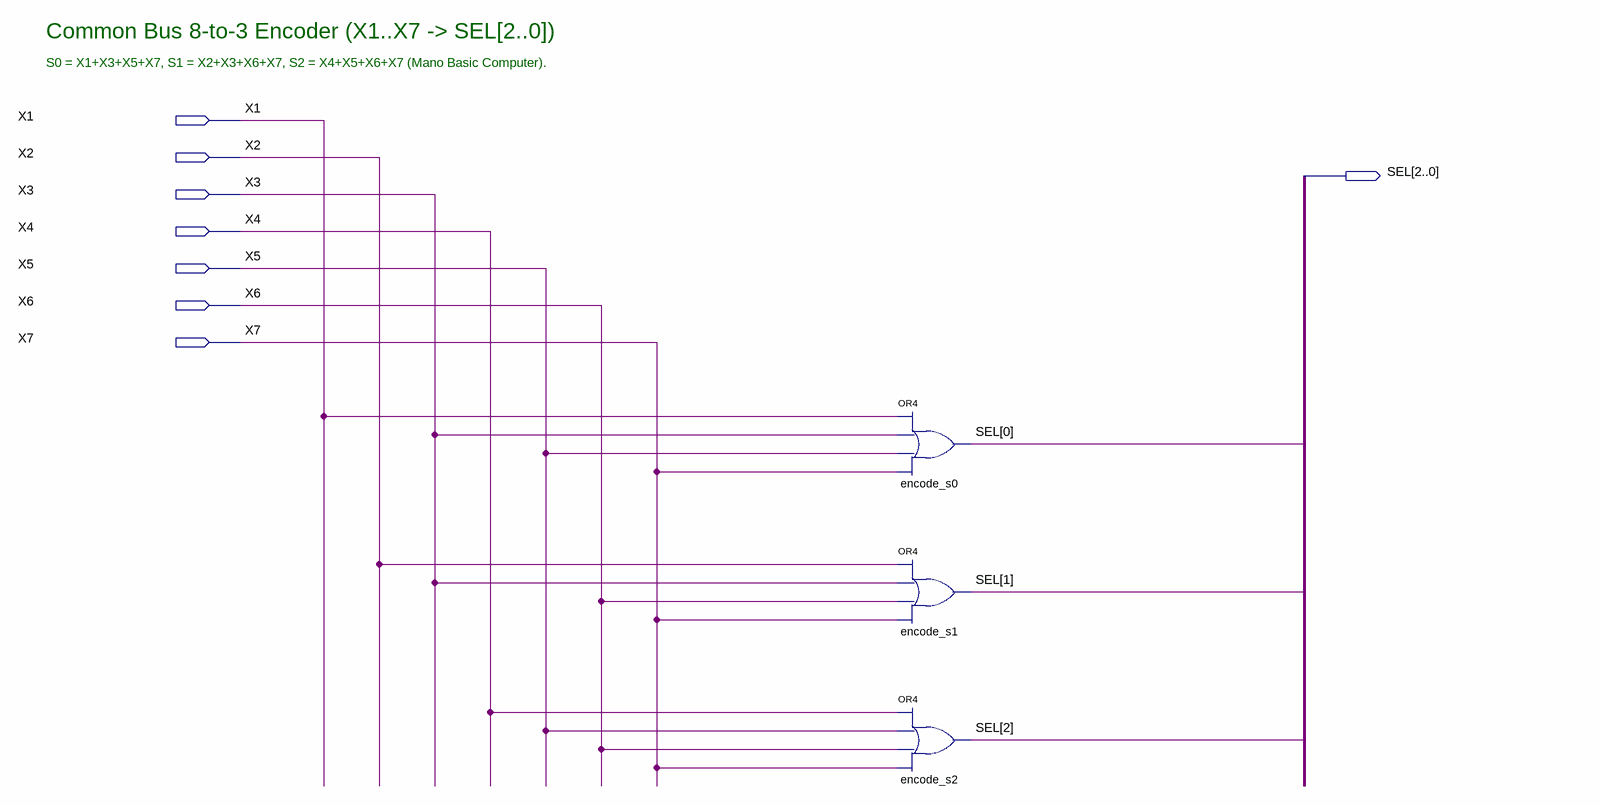
[diagram p0: schematic sheet]
// Quartus schematic bus_encoder83.bdf as structural Verilog: 3 symbols, 8 pins
module bus_encoder83 (
  input  X1,
  input  X2,
  input  X3,
  input  X4,
  input  X5,
  input  X6,
  input  X7,
  output [2:0] SEL
);

  or encode_s0 (SEL[0], X1, X3, X5, X7);
  or encode_s1 (SEL[1], X2, X3, X6, X7);
  or encode_s2 (SEL[2], X4, X5, X6, X7);

  // Notes on the sheet:
  //   Common Bus 8-to-3 Encoder (X1..X7 -> SEL[2..0])
  //   S0 = X1+X3+X5+X7, S1 = X2+X3+X6+X7, S2 = X4+X5+X6+X7 (Mano Basic Computer).
endmodule
